# Altium schematic sheet Sheet_1_2026-10-25.schdoc
size 245 x 148 mm
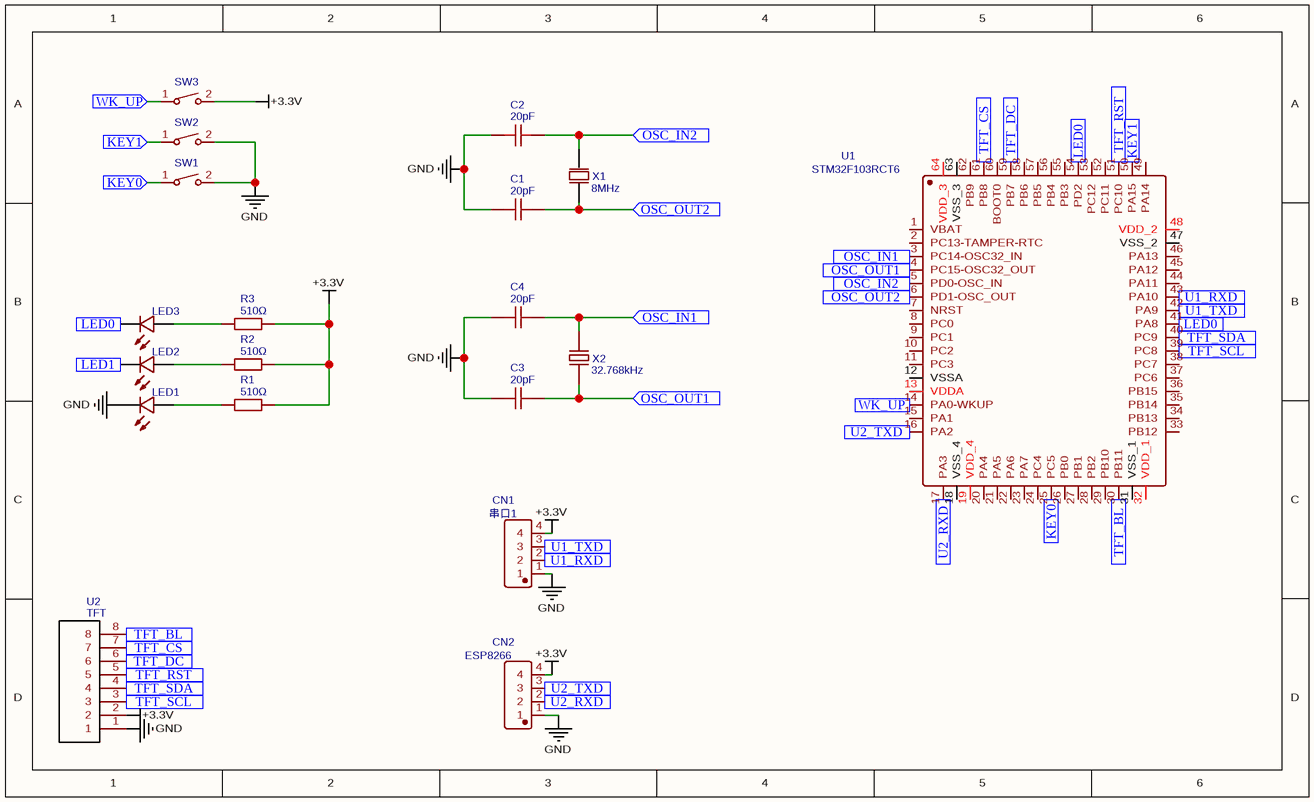
[diagram p0: Sheet_1_2026-10-25.schdoc]

## Parts
C1  20pF  [C0805]
C2  20pF  [C0805]
C3  20pF  [C0805]
C4  20pF  [C0805]
CN1  串口1  [CONN-TH_4P-P4.00_FLY4-HEADER4]
CN2  ESP8266  [CONN-TH_4P-P4.00_FLY4-HEADER4]
LED1  0805-1-YGC/FID  [LED0805-R-RD]  (value not drawn)
LED2  0805-1-YGC/FID  [LED0805-R-RD]  (value not drawn)
LED3  0805-1-YGC/FID  [LED0805-R-RD]  (value not drawn)
R1  510Ω  [R0805]
R2  510Ω  [R0805]
R3  510Ω  [R0805]
SW1  K2-1101DT-A4SW-01_C2909641  [KEY-TH_2P-L6.0-W3.5-P6.50]  (value not drawn)
SW2  K2-1101DT-A4SW-01_C2909641  [KEY-TH_2P-L6.0-W3.5-P6.50]  (value not drawn)
SW3  K2-1101DT-A4SW-01_C2909641  [KEY-TH_2P-L6.0-W3.5-P6.50]  (value not drawn)
U1  STM32F103RCT6  [LQFP-64_L10.0-W10.0-P0.50-LS12.0-BL]
U2  TFT  [排针8P]
X1  8MHz  [HC-49US_L11.5-W4.5-P4.88]
X2  32.768kHz  [DT-38_BD3.1-P0.80]

## Ports
KEY0 (in), KEY1 (in), LED0 (in), LED1 (in), OSC_IN1 (in), OSC_IN2 (in), OSC_OUT1 (in), OSC_OUT2 (in), TFT_BL (in), TFT_CS (in), TFT_DC (in), TFT_RST (in), TFT_SCL (in), TFT_SDA (in), U1_RXD (in), U1_TXD (in), U2_RXD (in), U2_TXD (in), WK_UP (in)

## Nets
+3.3V: CN1.4 CN2.4 R1.2 R2.2 R3.2 SW3.2 U2.2
GND: C1.1 C2.1 C3.1 C4.1 CN1.1 CN2.1 LED1.2(C) SW1.2 SW2.2 U2.1
KEY0: SW1.1 U1.25(PC5) ; port KEY0
KEY1: SW2.1 U1.50(PA15) ; port KEY1
LED0: LED3.2(C) U1.41(PA8) U1.54(PD2) ; port LED0
LED1: LED2.2(C) ; port LED1
OSC_IN1: C4.2 U1.3(PC14-OSC32_IN) X2.2 ; port OSC_IN1
OSC_IN2: C2.2 U1.5(PD0-OSC_IN) X1.2(OSC2) ; port OSC_IN2
OSC_OUT1: C3.2 U1.4(PC15-OSC32_OUT) X2.1 ; port OSC_OUT1
OSC_OUT2: C1.2 U1.6(PD1-OSC_OUT) X1.1(OSC1) ; port OSC_OUT2
TFT_BL: U1.30(PB11) U2.8 ; port TFT_BL
TFT_CS: U1.61(PB8) U2.7 ; port TFT_CS
TFT_DC: U1.59(PB7) U2.6 ; port TFT_DC
TFT_RST: U1.51(PC10) U2.5 ; port TFT_RST
TFT_SCL: U1.39(PC8) U2.3 ; port TFT_SCL
TFT_SDA: U1.40(PC9) U2.4 ; port TFT_SDA
U1_RXD: CN1.2 U1.43(PA10) ; port U1_RXD
U1_TXD: CN1.3 U1.42(PA9) ; port U1_TXD
U2_RXD: CN2.2 U1.17(PA3) ; port U2_RXD
U2_TXD: CN2.3 U1.16(PA2) ; port U2_TXD
WK_UP: SW3.1 U1.14(PA0-WKUP) ; port WK_UP
NetLED1_1: LED1.1(A) R1.1
NetLED2_1: LED2.1(A) R2.1
NetLED3_1: LED3.1(A) R3.1

Not connected (* = marked no-connect by the designer): U1 1(VBAT) 2(PC13-TAMPER-RTC) 7(NRST) 8(PC0) 9(PC1) 10(PC2) 11(PC3) 12(VSSA) 13(VDDA) 15(PA1) 18(VSS_4) 19(VDD_4) 20(PA4) 21(PA5) 22(PA6) 23(PA7) 24(PC4) 26(PB0) 27(PB1) 28(PB2) 29(PB10) 31(VSS_1) 32(VDD_1) 33(PB12) 34(PB13) 35(PB14) 36(PB15) 37(PC6) 38(PC7) 44(PA11) 45(PA12) 46(PA13) 47(VSS_2) 48(VDD_2) 49(PA14) 52(PC11) 53(PC12) 55(PB3) 56(PB4) 57(PB5) 58(PB6) 60(BOOT0) 62(PB9) 63(VSS_3) 64(VDD_3)

## Library data of the parts
C1-C4 = 20pF: Manufacturer: KEMET(基美); Manufacturer Part: C0805C200J5GACTU; nameAlias: Value; Contributor: lcsc; Supplier: LCSC; Supplier Part: C2169832; JLCPCB Part Class: Extended Part; spicePre: C; spiceSymbolName: C0805C200J5GACTU
CN1 = 串口1: Manufacturer Part: FLY4-Header4; Manufacturer: null; Contributor: LCSC; Supplier: LCSC; Supplier Part: C9900006105; JLCPCB Part Class: Extended Part; spicePre: C; spiceSymbolName: FLY4-HEADER4
CN2 = ESP8266: Manufacturer Part: FLY4-Header4; Manufacturer: null; Contributor: LCSC; Supplier: LCSC; Supplier Part: C9900006105; JLCPCB Part Class: Extended Part; spicePre: C; spiceSymbolName: FLY4-HEADER4
LED1-LED3 = 0805-1-YGC/FID: Manufacturer: null; Contributor: lcsc; Supplier: LCSC; Supplier Part: C9900013796; Manufacturer Part: 0805-1-YGC/FID; JLCPCB Part Class: Extended Part; spicePre: L; spiceSymbolName: 0805-1-YGC/FID
R1-R3 = 510Ω: Manufacturer: Viking(光颉); Manufacturer Part: ARG05FTC5100; nameAlias: Value; Contributor: LCSC; Supplier: LCSC; Supplier Part: C218609; JLCPCB Part Class: Extended Part; spicePre: R; spiceSymbolName: ARG05FTC5100
SW1-SW3 = K2-1101DT-A4SW-01_C2909641: Manufacturer: 韩国韩荣; Contributor: LCSC; Supplier: LCSC; Supplier Part: C2909641; Manufacturer Part: K2-1101DT-A4SW-01; JLCPCB Part Class: Extended Part; spicePre: S; spiceSymbolName: K2-1101DT-A4SW-01_C2909641
U1 = STM32F103RCT6: Manufacturer: ST(意法半导体); Supplier: LCSC; Manufacturer Part: STM32F103RCT6; Supplier Part: C8323; JLCPCB Part Class: Extended Part; spicePre: U; spiceSymbolName: STM32F103RCT6
U2 = TFT: Contributor: 350xyq; spicePre: U; spiceSymbolName: Header8P
X1 = 8MHz: Manufacturer: HOSONIC(鸿星); Manufacturer Part: E49A8E00000FE10CO; nameAlias: Value; Supplier: LCSC; Supplier Part: C111806; JLCPCB Part Class: Extended Part; spicePre: X; spiceSymbolName: E49A8E00000FE10CO
X2 = 32.768kHz: Manufacturer: KYX(凯越翔); Manufacturer Part: K383276812510; nameAlias: Value; Contributor: lcsc; Supplier: LCSC; Supplier Part: C18209038; JLCPCB Part Class: Extended Part; spicePre: X; spiceSymbolName: K383276812510